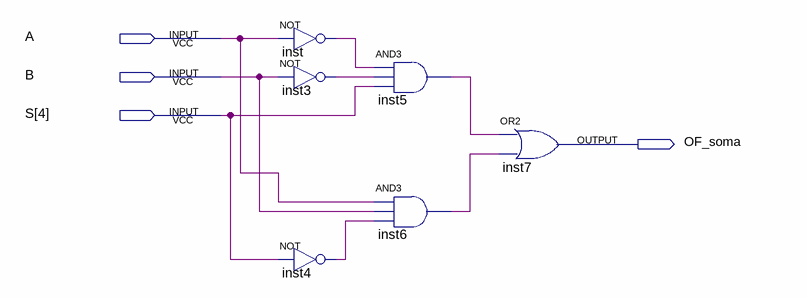
[diagram p0: schematic sheet]
// Quartus schematic OF_soma.bdf as structural Verilog: 6 symbols, 4 pins
module OF_soma (
  input  A,
  input  B,
  input  [4:4] S,
  output OF_soma
);

  wire inst3_out, inst4_out, inst5_out, inst6_out, inst_out;

  not inst (inst_out, A);
  not inst3 (inst3_out, B);
  not inst4 (inst4_out, S[4]);
  and inst5 (inst5_out, inst_out, inst3_out, S[4]);
  and inst6 (inst6_out, A, B, inst4_out);
  or inst7 (OF_soma, inst5_out, inst6_out);
endmodule
